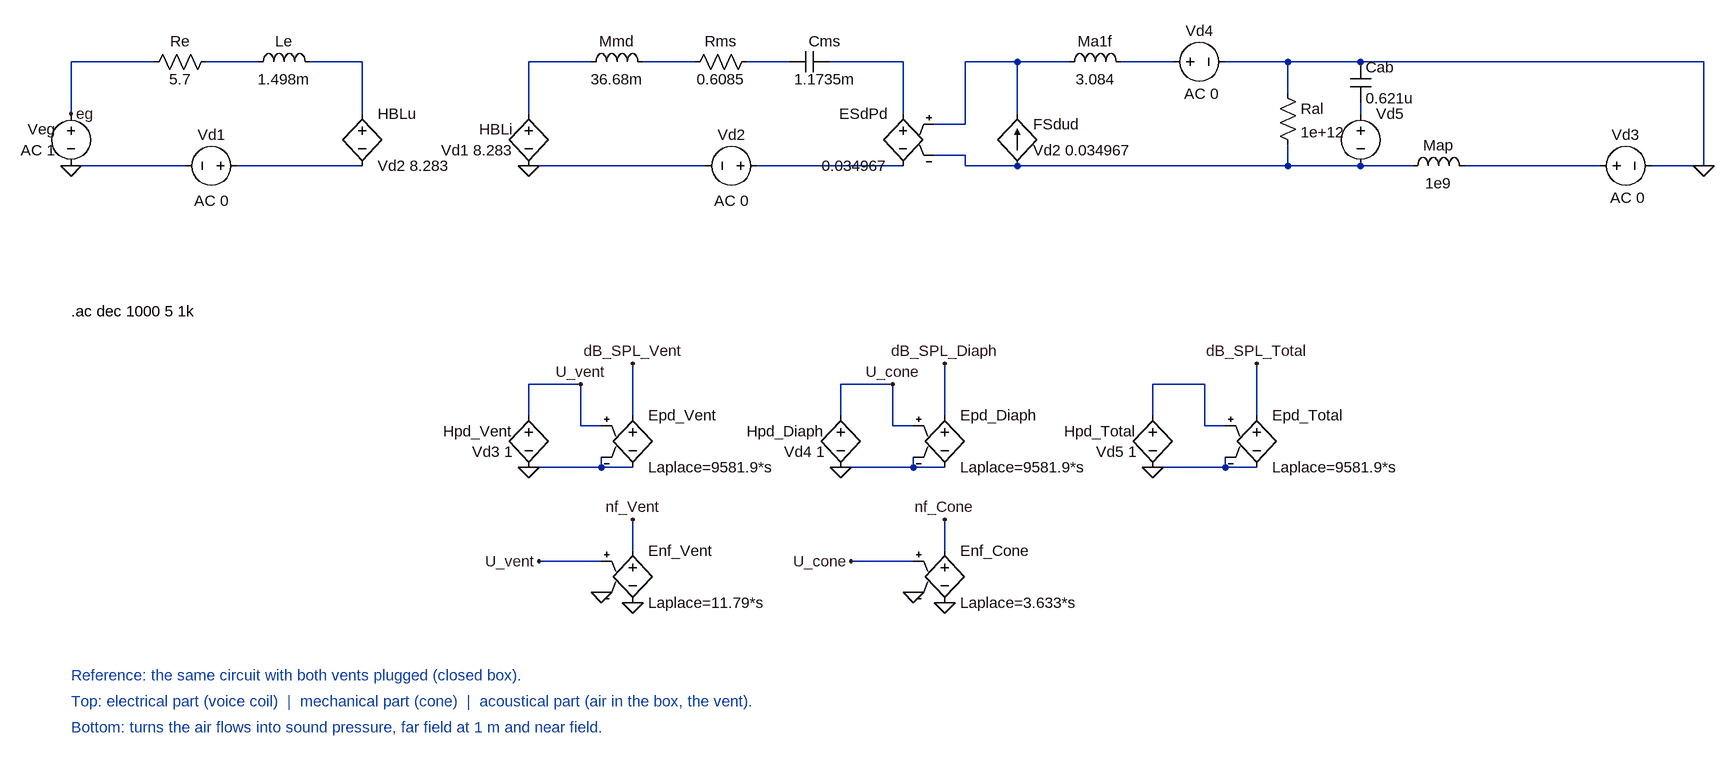
[diagram p0: schematic Woofer_Vented_L160_plugged.asc]
Woofer_Vented_L160_plugged.asc, the LTspice schematic file:
Version 4.1
SHEET 1 2600 1100
FLAG 0 -64 eg
WIRE 128 -144 0 -144
WIRE 288 -144 208 -144
WIRE 448 -144 368 -144
WIRE 800 -144 704 -144
WIRE 960 -144 880 -144
WIRE 1104 -144 1040 -144
WIRE 1280 -144 1168 -144
WIRE 1456 -144 1376 -144
WIRE 1536 -144 1456 -144
WIRE 1696 -144 1616 -144
WIRE 1872 -144 1776 -144
WIRE 1984 -144 1872 -144
WIRE 2512 -144 1984 -144
WIRE 1872 -96 1872 -144
WIRE 0 -64 0 -144
WIRE 448 -64 448 -144
WIRE 704 -64 704 -144
WIRE 1280 -64 1280 -144
WIRE 1456 -64 1456 -144
WIRE 1984 -64 1984 -80
WIRE 1376 -48 1376 -144
WIRE 1376 -48 1328 -48
WIRE 1376 0 1328 0
WIRE 176 16 0 16
WIRE 448 16 256 16
WIRE 976 16 704 16
WIRE 1280 16 1056 16
WIRE 1376 16 1376 0
WIRE 1456 16 1376 16
WIRE 1616 16 1456 16
WIRE 1872 16 1872 -16
WIRE 1872 16 1696 16
WIRE 1984 16 1872 16
WIRE 2064 16 1984 16
WIRE 2208 16 2144 16
WIRE 2352 16 2288 16
WIRE 2512 16 2512 -144
WIRE 2512 16 2432 16
WIRE 784 352 704 352
WIRE 1264 352 1184 352
WIRE 1744 352 1664 352
WIRE 704 400 704 352
WIRE 864 400 864 320
WIRE 1184 400 1184 352
WIRE 1344 400 1344 320
WIRE 1664 400 1664 352
WIRE 1824 400 1824 320
WIRE 784 416 784 352
WIRE 816 416 784 416
WIRE 1264 416 1264 352
WIRE 1296 416 1264 416
WIRE 1744 416 1744 352
WIRE 1776 416 1744 416
WIRE 816 480 816 464
WIRE 816 480 704 480
WIRE 864 480 816 480
WIRE 1296 480 1296 464
WIRE 1296 480 1184 480
WIRE 1344 480 1296 480
WIRE 1776 480 1776 464
WIRE 1776 480 1664 480
WIRE 1824 480 1776 480
WIRE 1696 16 1616 16
WIRE 816 624 720 624
WIRE 864 608 864 560
WIRE 1296 624 1200 624
WIRE 1344 608 1344 560
FLAG 0 16 0
FLAG 704 16 0
FLAG 2512 16 0
FLAG 704 480 0
FLAG 864 320 dB_SPL_Vent
FLAG 1184 480 0
FLAG 1344 320 dB_SPL_Diaph
FLAG 1664 480 0
FLAG 1824 320 dB_SPL_Total
FLAG 784 352 U_vent
FLAG 720 624 U_vent
FLAG 816 672 0
FLAG 864 688 0
FLAG 864 560 nf_Vent
FLAG 1264 352 U_cone
FLAG 1200 624 U_cone
FLAG 1296 672 0
FLAG 1344 688 0
FLAG 1344 560 nf_Cone
SYMBOL voltage 0 -80 R0
WINDOW 0 -24 40 Right 2
WINDOW 3 -24 72 Right 2
WINDOW 123 -24 72 Right 2
SYMATTR InstName Veg
SYMATTR Value ""
SYMATTR Value2 AC 1
SYMBOL res 112 -128 R270
WINDOW 0 32 56 VTop 2
WINDOW 3 5 56 VBottom 2
SYMATTR InstName Re
SYMATTR Value 5.7
SYMBOL ind 272 -128 R270
WINDOW 0 32 56 VTop 2
WINDOW 3 5 56 VBottom 2
SYMATTR InstName Le
SYMATTR Value 1.498m
SYMATTR SpiceLine Rser=1p
SYMBOL h 448 -80 R0
SYMATTR InstName HBLu
SYMATTR Value Vd2 8.283
SYMBOL voltage 272 16 R90
WINDOW 0 -32 56 VBottom 2
WINDOW 3 32 56 VTop 2
WINDOW 123 69 56 VBottom 2
WINDOW 39 0 0 Left 0
SYMATTR InstName Vd1
SYMATTR Value ""
SYMATTR Value2 AC 0
SYMBOL h 704 -80 R0
WINDOW 0 -24 40 Right 2
WINDOW 3 -24 72 Right 2
WINDOW 123 -24 72 Right 2
SYMATTR InstName HBLi
SYMATTR Value Vd1 8.283
SYMBOL ind 784 -128 R270
WINDOW 0 32 56 VTop 2
WINDOW 3 5 56 VBottom 2
SYMATTR InstName Mmd
SYMATTR Value 36.68m
SYMATTR SpiceLine Rser=1p
SYMBOL res 944 -128 R270
WINDOW 0 32 56 VTop 2
WINDOW 3 5 56 VBottom 2
SYMATTR InstName Rms
SYMATTR Value 0.6085
SYMBOL cap 1104 -128 R270
WINDOW 0 32 56 VTop 2
WINDOW 3 5 56 VBottom 2
SYMATTR InstName Cms
SYMATTR Value 1.1735m
SYMBOL e 1280 -80 M0
SYMATTR InstName ESdPd
SYMATTR Value 0.034967
SYMBOL voltage 1072 16 R90
WINDOW 0 -32 56 VBottom 2
WINDOW 3 32 56 VTop 2
WINDOW 123 69 56 VBottom 2
WINDOW 39 0 0 Left 0
SYMATTR InstName Vd2
SYMATTR Value ""
SYMATTR Value2 AC 0
SYMBOL f 1456 16 R180
WINDOW 0 -24 64 Right 2
WINDOW 3 -24 24 Right 2
SYMATTR InstName FSdud
SYMATTR Value Vd2 0.034967
SYMBOL ind 1520 -128 R270
WINDOW 0 32 56 VTop 2
WINDOW 3 5 56 VBottom 2
SYMATTR InstName Ma1f
SYMATTR Value 3.084
SYMATTR SpiceLine Rser=1p
SYMBOL voltage 1680 -144 R270
WINDOW 0 32 56 VTop 2
WINDOW 3 -32 56 VBottom 2
WINDOW 123 -65 59 VTop 2
WINDOW 39 0 0 Left 0
SYMATTR InstName Vd4
SYMATTR Value ""
SYMATTR Value2 AC 0
SYMBOL res 1856 -112 R0
SYMATTR InstName Ral
SYMATTR Value 1e+12
SYMBOL cap 1968 -144 R0
SYMATTR InstName Cab
SYMATTR Value 0.621u
SYMBOL voltage 1984 -80 R0
WINDOW 39 0 0 Left 0
SYMATTR InstName Vd5
SYMATTR Value ""
SYMATTR Value2 AC 0
SYMBOL ind 2048 32 R270
WINDOW 0 32 56 VTop 2
WINDOW 3 5 56 VBottom 2
SYMATTR InstName Map
SYMATTR Value 1e9
SYMATTR SpiceLine Rser=348.9
WIRE 2208 16 2288 16
SYMBOL voltage 2336 16 R270
WINDOW 0 32 56 VTop 2
WINDOW 3 -32 56 VBottom 2
WINDOW 123 -65 59 VTop 2
WINDOW 39 0 0 Left 0
SYMATTR InstName Vd3
SYMATTR Value ""
SYMATTR Value2 AC 0
SYMBOL h 704 384 R0
WINDOW 0 -24 40 Right 2
WINDOW 3 -24 72 Right 2
WINDOW 123 -24 72 Right 2
SYMATTR InstName Hpd_Vent
SYMATTR Value Vd3 1
SYMBOL e 864 384 R0
SYMATTR InstName Epd_Vent
SYMATTR Value Laplace=9581.9*s
SYMBOL h 1184 384 R0
WINDOW 0 -24 40 Right 2
WINDOW 3 -24 72 Right 2
WINDOW 123 -24 72 Right 2
SYMATTR InstName Hpd_Diaph
SYMATTR Value Vd4 1
SYMBOL e 1344 384 R0
SYMATTR InstName Epd_Diaph
SYMATTR Value Laplace=9581.9*s
SYMBOL h 1664 384 R0
WINDOW 0 -24 40 Right 2
WINDOW 3 -24 72 Right 2
WINDOW 123 -24 72 Right 2
SYMATTR InstName Hpd_Total
SYMATTR Value Vd5 1
SYMBOL e 1824 384 R0
SYMATTR InstName Epd_Total
SYMATTR Value Laplace=9581.9*s
SYMBOL e 864 592 R0
SYMATTR InstName Enf_Vent
SYMATTR Value Laplace=11.79*s
SYMBOL e 1344 592 R0
SYMATTR InstName Enf_Cone
SYMATTR Value Laplace=3.633*s
TEXT 0 240 Left 2 !.ac dec 1000 5 1k
TEXT 0 800 Left 2 ;Reference: the same circuit with both vents plugged (closed box).
TEXT 0 840 Left 2 ;Top: electrical part (voice coil)  |  mechanical part (cone)  |  acoustical part (air in the box, the vent).
TEXT 0 880 Left 2 ;Bottom: turns the air flows into sound pressure, far field at 1 m and near field.

The netlist it stands for:
* Woofer_Vented_L160_plugged.asc
Veg eg 0 AC 1
Re eg N001 5.7
Le N001 N002 1.498m Rser=1p
HBLu N002 N011 Vd2 8.283
Vd1 N011 0 AC 0
HBLi N003 0 Vd1 8.283
L§Mmd N003 N004 36.68m Rser=1p
Rms N004 N005 0.6085
Cms N005 N006 1.1735m
ESdPd N006 N012 N007 N010 0.034967
Vd2 N012 0 AC 0
FSdud N010 N007 Vd2 0.034967
L§Ma1f N007 N008 3.084 Rser=1p
Vd4 N008 0 AC 0
Ral 0 N010 1e+12
Cab 0 N009 0.621u
Vd5 N009 N010 AC 0
L§Map N010 N013 1e9 Rser=348.9
Vd3 N013 0 AC 0
Hpd_Vent U_vent 0 Vd3 1
Epd_Vent dB_SPL_Vent 0 U_vent 0 Laplace=9581.9*s
Hpd_Diaph U_cone 0 Vd4 1
Epd_Diaph dB_SPL_Diaph 0 U_cone 0 Laplace=9581.9*s
Hpd_Total N014 0 Vd5 1
Epd_Total dB_SPL_Total 0 N014 0 Laplace=9581.9*s
Enf_Vent nf_Vent 0 U_vent 0 Laplace=11.79*s
Enf_Cone nf_Cone 0 U_cone 0 Laplace=3.633*s
.ac dec 1000 5 1k
* Reference: the same circuit with both vents plugged (closed box).
* Top: electrical part (voice coil)  |  mechanical part (cone)  |  acoustical part (air in the box, the vent).
* Bottom: turns the air flows into sound pressure, far field at 1 m and near field.
.backanno
.end